# Altium schematic sheet RS485 Receiver.SchDoc
size C; SheetNumber: 3; SheetTotal: 7
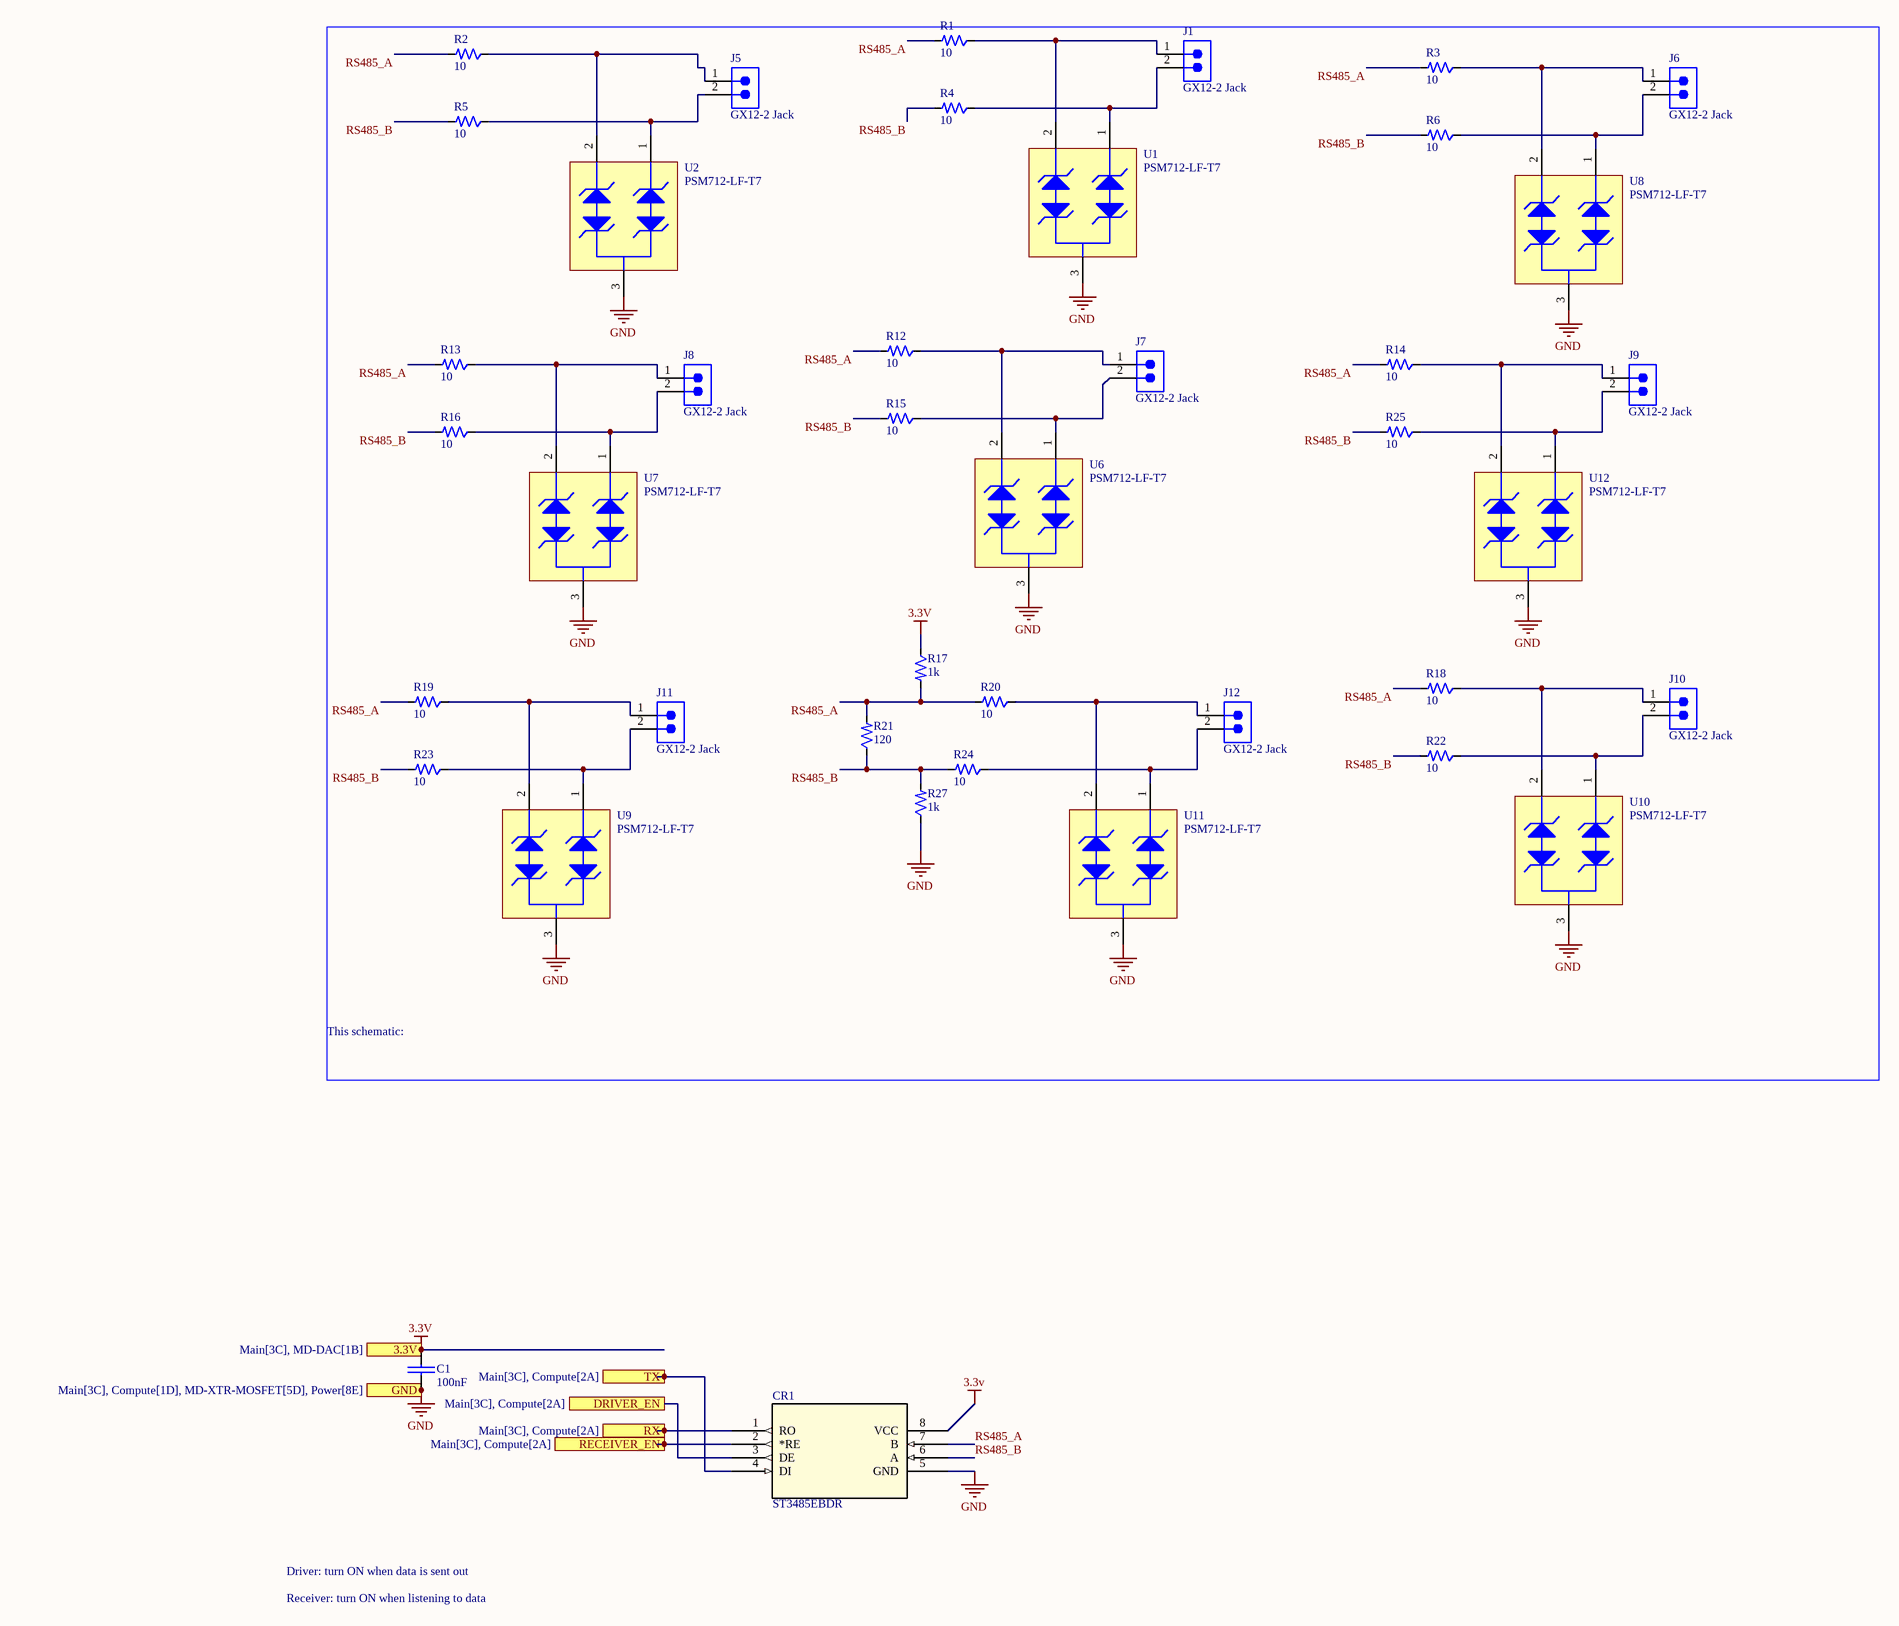
[diagram p0: RS485 Receiver.SchDoc]

## Parts
C1  value 100nF  [PCC-001-0015-1]  (hidden comment: Capacitor 220pF, 5%, 50V, C0G, 0805)
CR1  ST3485EBDR  [SO-8_STM]
J1  GX12-2 Jack  [PCC-001-0161-1]
J5  GX12-2 Jack  [PCC-001-0161-1]
J6  GX12-2 Jack  [PCC-001-0161-1]
J7  GX12-2 Jack  [PCC-001-0161-1]
J8  GX12-2 Jack  [PCC-001-0161-1]
J9  GX12-2 Jack  [PCC-001-0161-1]
J10  GX12-2 Jack  [PCC-001-0161-1]
J11  GX12-2 Jack  [PCC-001-0161-1]
J12  GX12-2 Jack  [PCC-001-0161-1]
R1  value 10  [PCC-001-0067-1]  (hidden comment: Resistor 750R, 0.1%, 1/8W, 0805)
R2  value 10  [PCC-001-0067-1]  (hidden comment: Resistor 750R, 0.1%, 1/8W, 0805)
R3  value 10  [PCC-001-0067-1]  (hidden comment: Resistor 750R, 0.1%, 1/8W, 0805)
R4  value 10  [PCC-001-0067-1]  (hidden comment: Resistor 750R, 0.1%, 1/8W, 0805)
R5  value 10  [PCC-001-0067-1]  (hidden comment: Resistor 750R, 0.1%, 1/8W, 0805)
R6  value 10  [PCC-001-0067-1]  (hidden comment: Resistor 750R, 0.1%, 1/8W, 0805)
R12  value 10  [PCC-001-0067-1]  (hidden comment: Resistor 750R, 0.1%, 1/8W, 0805)
R13  value 10  [PCC-001-0067-1]  (hidden comment: Resistor 750R, 0.1%, 1/8W, 0805)
R14  value 10  [PCC-001-0067-1]  (hidden comment: Resistor 750R, 0.1%, 1/8W, 0805)
R15  value 10  [PCC-001-0067-1]  (hidden comment: Resistor 750R, 0.1%, 1/8W, 0805)
R16  value 10  [PCC-001-0067-1]  (hidden comment: Resistor 750R, 0.1%, 1/8W, 0805)
R17  value 1k  [PCC-001-0067-1]  (hidden comment: Resistor 750R, 0.1%, 1/8W, 0805)
R18  value 10  [PCC-001-0067-1]  (hidden comment: Resistor 750R, 0.1%, 1/8W, 0805)
R19  value 10  [PCC-001-0067-1]  (hidden comment: Resistor 750R, 0.1%, 1/8W, 0805)
R20  value 10  [PCC-001-0067-1]  (hidden comment: Resistor 750R, 0.1%, 1/8W, 0805)
R21  value 120  [PCC-001-0067-1]  (hidden comment: Resistor 750R, 0.1%, 1/8W, 0805)
R22  value 10  [PCC-001-0067-1]  (hidden comment: Resistor 750R, 0.1%, 1/8W, 0805)
R23  value 10  [PCC-001-0067-1]  (hidden comment: Resistor 750R, 0.1%, 1/8W, 0805)
R24  value 10  [PCC-001-0067-1]  (hidden comment: Resistor 750R, 0.1%, 1/8W, 0805)
R25  value 10  [PCC-001-0067-1]  (hidden comment: Resistor 750R, 0.1%, 1/8W, 0805)
R27  value 1k  [PCC-001-0067-1]  (hidden comment: Resistor 750R, 0.1%, 1/8W, 0805)
U1  PSM712-LF-T7  [PRKT-SOT23-3_V]
U2  PSM712-LF-T7  [PRKT-SOT23-3_V]
U6  PSM712-LF-T7  [PRKT-SOT23-3_V]
U7  PSM712-LF-T7  [PRKT-SOT23-3_V]
U8  PSM712-LF-T7  [PRKT-SOT23-3_V]
U9  PSM712-LF-T7  [PRKT-SOT23-3_V]
U10  PSM712-LF-T7  [PRKT-SOT23-3_V]
U11  PSM712-LF-T7  [PRKT-SOT23-3_V]
U12  PSM712-LF-T7  [PRKT-SOT23-3_V]

## Blocks framed on the sheet
This schematic:: J1 J5-J12 R1-R6 R12-R25 R27 U1 U2 U6-U12

## Ports
3.3V (see Main[3C], MD-DAC[1B]), DRIVER_EN (see Main[3C], Compute[2A]), GND (see Main[3C], Compute[1D], MD-XTR-MOSFET[5D], Power[8E]), RECEIVER_EN (see Main[3C], Compute[2A]), RX (see Main[3C], Compute[2A]), TX (see Main[3C], Compute[2A])

## Nets
3.3V: C1.1 CR1.8(VCC) R17.2 ; port 3.3V
GND: C1.2 CR1.5(GND) R27.2 U1.3 U2.3 U6.3 U7.3 U8.3 U9.3 U10.3 U11.3 U12.3 ; port GND
DRIVER_EN: CR1.3(DE) ; port DRIVER_EN
RECEIVER_EN: CR1.2(*RE) ; port RECEIVER_EN
RS485_A: CR1.7(B) R1.1 R2.1 R3.1 R12.1 R13.1 R14.1 R17.1 R18.1 R19.1 R20.1 R21.1
RS485_B: CR1.6(A) R4.1 R5.1 R6.1 R15.1 R16.1 R21.2 R22.1 R23.1 R24.1 R25.1 R27.1
RX: CR1.1(RO) ; port RX
TX: CR1.4(DI) ; port TX
NetJ1_1: J1.1 R1.2 U1.2
NetJ1_2: J1.2 R4.2 U1.1
NetJ5_1: J5.1 R2.2 U2.2
NetJ5_2: J5.2 R5.2 U2.1
NetJ6_1: J6.1 R3.2 U8.2
NetJ6_2: J6.2 R6.2 U8.1
NetJ7_1: J7.1 R12.2 U6.2
NetJ7_2: J7.2 R15.2 U6.1
NetJ8_1: J8.1 R13.2 U7.2
NetJ8_2: J8.2 R16.2 U7.1
NetJ9_1: J9.1 R14.2 U12.2
NetJ9_2: J9.2 R25.2 U12.1
NetJ10_1: J10.1 R18.2 U10.2
NetJ10_2: J10.2 R22.2 U10.1
NetJ11_1: J11.1 R19.2 U9.2
NetJ11_2: J11.2 R23.2 U9.1
NetJ12_1: J12.1 R20.2 U11.2
NetJ12_2: J12.2 R24.2 U11.1

## Notes on the sheet
- Driver: turn ON when data is sent out
- Receiver: turn ON when listening to data

## Library data of the parts
C1 = Capacitor 220pF, 5%, 50V, C0G, 0805-1: Capacitor, ceramic, 220pF, 5%, 50V, C0G, 0805; Manufacturer Part Number 1: CL21C221JBANNNC; Manufacturer 1: Samsung Electro-Mechanics; Supplier Part Number 1: 1276-1164-1-ND; Package: 0805; Tolerance: 5%; Voltage: 50V; Manufacturer 2: YAGEO; Supplier Part Number 2: C107112; Dielectric: C0G; Supplier 2: LCSC; Manufacturer Part Number 2: CC0805JRNPO9BN221; Supplier 1: DigiKey
CR1 = ST3485EBDR: 3.3 V Powered, 15 kV ESD protected, up to 12 Mbps RS-485/RS-422 transceiver, [-40oC, 85oC] temperature range; Manufacturer_Name: STMicroelectronics; Copyright: Copyright (C) 2025 Ultra Librarian. All rights reserved.; Manufacturer_Part_Number: ST3485EBDR; RefDes: RefDes; Type: Type
J1 J5-J12 = GX12-2 Jack-1: 2 pin GX12 aviation connector jack for throughhole soldering; Manufacturer 1: *; Manufacturer Part Number 2: *; Supplier Part Number 2: *; Supplier 1: DigiKey; Manufacturer 2: *; Manufacturer Part Number 1: *; Supplier Part Number 1: *; Supplier 2: LCSC
R1-R6 R12-R25 R27 = Resistor 750R, 0.1%, 1/8W, 0805-1: Resistor, 750R, 0.1%, 1/8W, 0805; Manufacturer Part Number 1: RT0805BRD07750RL; Manufacturer 1: YAGEO; Manufacturer 2: RESI; Supplier Part Number 1: YAG4940CT-ND; Manufacturer Part Number 2: PTFR0805B750RP9; Tolerance: 0.1%; Supplier Part Number 2: C2849336; Supplier 1: DigiKey; Power: 1/8W; Supplier 2: LCSC; Package: 0805
U1 U2 U6-U12 = CMP-2000-07553-1: TVS Array - Asymmetrical Data Line Protector, 600 W, 7.5 V, -55 to 150 degC, 3-Pin SOT23, RoHS, Tape and Reel; Manufacturer: Protek Devices; Min Breakdown Voltage: 7.5V; Direction: Bidirectional; Capacitance: 75pF; Current: 20uA; Power Dissipation: 600W; Working Voltage: 7V; Voltage: 12V; Case\/Package: SOT-23; Clamping Voltage: 17V; Element Configuration: Dual; Mounting Technology: SurfaceMount; RoHSCompliant: True; Radiation Hardening: No; Depth: 1.4mm; Lead Free: LeadFree; Package Description: 3-Pin Small Outline Transistor, Body 2.92 x 1.3 mm, Pitch 0.94 mm; Max Operating Temperature: 150degC; Length: 3.04mm; Manufacturer URL: http://www.protekdevices.com/; Min Operating Temperature: -55degC; Leakage Current: 20uA; Datasheet URL: www.protekdevices.com/xyz/documents/datasheets/psm712.pdf; Packaging: TapeandReel; Datasheet Version: 10/2013; Package Reference: SOT23-3; Number of Pins: 3